# Altium project ADCS_CubeSat_1U.PrjPcb (part 2 of 2)

## Sheet 52_BUCK_5V.SchDoc
size A4; SheetNumber: 12; SheetTotal: 16
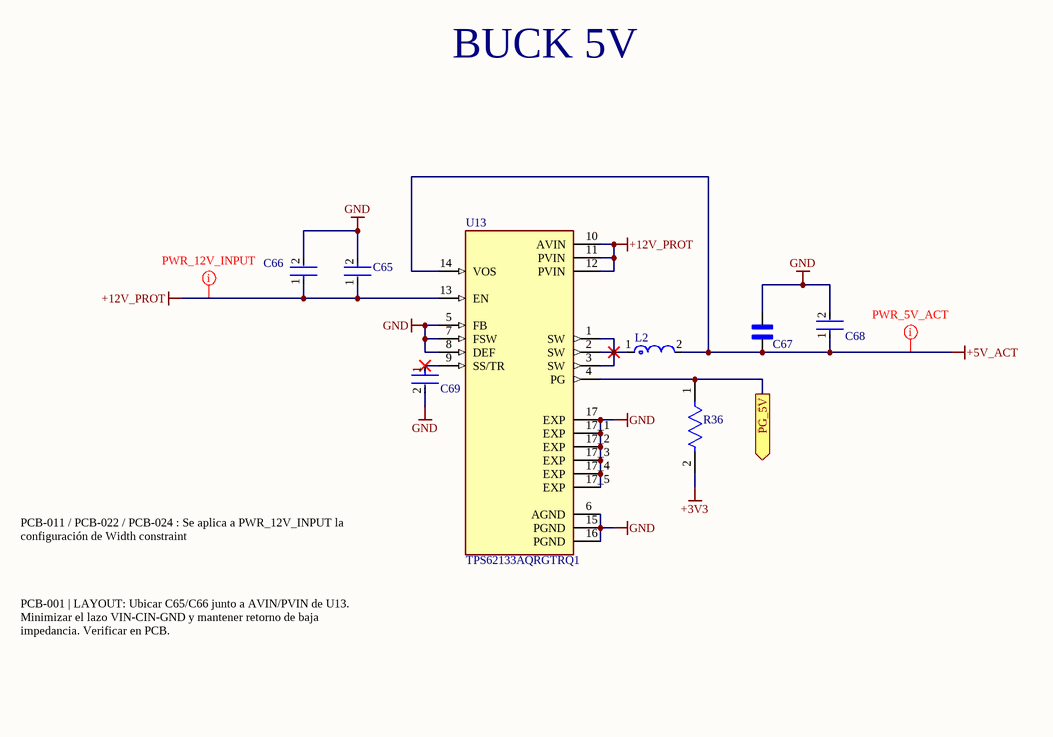
[diagram p12: 52_BUCK_5V.SchDoc]

### Parts
C65  GCM32ER71E106KA57K  [FP-GCM32E-0_3-IPC_B]  (value not drawn)
C66  C0603C104K3RACTU  [FP-C0603C-CF-IPC_B]  (value not drawn)
C67  C3225X7R1A226M230AC  [CAP_C3225X7R1A226M230AC]  (value not drawn)
C68  C0603C104K3RACTU  [FP-C0603C-CF-IPC_B]  (value not drawn)
C69  C0603C332J5GACTU  [FP-C0603C-CF-IPC_B]  (value not drawn)
L2  XFL4020-222MEC  [FP-XFL4020-MFG]  (value not drawn)
R36  RC0603FR-07100KL  [FP-RC0603-0_55-MFG]  (value not drawn)
U13  TPS62133AQRGTRQ1  [QFN50P300X300X100-17N]

### Ports
PG_5V (out)

### Nets
+3V3: R36.2
+5V_ACT: C67.2 C68.1 L2.2 U13.14(VOS)
+12V_PROT: C65.1 C66.1 U13.10(AVIN) U13.11(PVIN) U13.12(PVIN) U13.13(EN)
GND: C65.2 C66.2 C67.1 C68.2 C69.2 U13.5(FB) U13.6(AGND) U13.7(FSW) U13.8(DEF) U13.15(PGND) U13.16(PGND) U13.17(EXP) U13.17_1(EXP) U13.17_2(EXP) U13.17_3(EXP) U13.17_4(EXP) U13.17_5(EXP)
NetC69_1: C69.1 U13.9(SS/TR)
NetL2_1: L2.1 U13.1(SW) U13.2(SW) U13.3(SW)
NetR36_1: R36.1 U13.4(PG) ; port PG_5V

### Layout directives
net class PWR_12V_INPUT; rule Width Constraint [Pref Width = 78.74mil    Min Width = 59.055mil    Max Width = 118.11mil]: +12V_PROT
net class PWR_5V_ACT: +5V_ACT

### Notes on the sheet
- BUCK 5V
- PCB-011 / PCB-022 / PCB-024 : Se aplica a PWR_12V_INPUT la configuración de Width constraint
- PCB-001 | LAYOUT: Ubicar C65/C66 junto a AVIN/PVIN de U13. Minimizar el lazo VIN-CIN-GND y mantener retorno de baja impedancia. Verificar en PCB.

### Library data of the parts
C65 = CMP-2000-06320-2: Ceramic Capacitor for Automotive 10uF ±10% 25VDC X7R 1210 Embossed T/R; Voltage Rating (DC): 25V; Height: 2.5mm; Ratings: AEC-Q200; Termination: SMD/SMT; Case Code (Imperial): 1210; Packaging: Tape and Reel; Min Operating Temperature: -55°C; Radiation Hardening: No; Mount: Surface Mount; Depth: 2.5mm; Case Code (Metric): 3225; Length: 3.2mm; Tolerance: 10%; Package Quantity: 4000; Width: 0.098inch; Max Operating Temperature: 125°C; Thickness: 0.106inch; Case/Package: 1210; Capacitance: 10uF; Voltage Rating: 25V; Dielectric: X7R
C66 C68 = CMP-2006-03057-2: CAP CER 0.1UF 25V X7R 0603; Manufacturer: KEMET; Value: 0.10 μF; Material: Ceramic; Tolerance: 0.1; Temperature Coefficient: 30ppm/°C; Automotive Grade: Grade 1; Lead Free: Yes; Device Class L3: Ceramic Capacitors; Voltage Rating: 25 V; Manufacturer Part Number: C0603C104K3RACTU; Digikey Description: CAP CER 0.1UF 25V X7R 0603; Mouser Description: Multilayer Ceramic Capacitors MLCC - SMD/SMT 25volts 0.1uF X7R 10%; Package: C0603C-CF; Temperature Range Low: -55°C; Automotive: Yes; Device Class L2: Capacitors; Octopart: https://octopart.com/c0603c104k3ractu-kemet-127541; ComponentLink2Description: Datasheet; ComponentLink2URL: https://api.kemet.com/component-edge/download/datasheet/C0603C100J5GACAUTO.pdf; Temperature Range High: +125°C; RoHS: TRUE; Device Class L1: Passive Components; Category: Cap; Temperature: -55°C to +125°C; Capacitance: 0.10 μF; Height: 0.87mm; Temperature Characteristic: X7R
C67 = C3225X7R1A226M230AC: 22 ÂµF Â±20% 10V Ceramic Capacitor X7R 1210 (3225 Metric); MF: TDK; SnapEDA_Link: https://www.snapeda.com/parts/C3225X7R1A226M230AC/TDK/view-part/?ref=snap; Package: 3225-2 TDK; Value: *; MP: C3225X7R1A226M230AC; Check_prices: https://www.snapeda.com/parts/C3225X7R1A226M230AC/TDK/view-part/?ref=eda
C69 = CMP-2006-03334-2: CAP CER 3300PF 50V 5% NP0 0603; Manufacturer: KEMET; Value: 3,300 pF; Temperature Characteristic: C0G; Temperature Coefficient: 30ppm/°C; Tolerance: 0.05; Automotive Grade: Grade 1; Material: Ceramic; Category: Cap; Digikey Description: CAP CER 3300PF 50V 5% NP0 0603; Temperature Range Low: -55°C; Mouser Description: Multilayer Ceramic Capacitors MLCC - SMD/SMT 50volts 3300pF 5% C0G; Device Class L2: Capacitors; Octopart: https://octopart.com/c0603c332j5gactu-kemet-12580539; Package: C0603C-CF; Lead Free: Yes; Temperature Range High: +125°C; Automotive: Yes; ComponentLink2URL: https://api.kemet.com/component-edge/download/datasheet/C0603C100J5GACAUTO.pdf; Voltage Rating: 50 V; Device Class L3: Ceramic Capacitors; Temperature: -55°C to +125°C; ComponentLink2Description: Datasheet; Device Class L1: Passive Components; Manufacturer Part Number: C0603C332J5GACTU; Capacitance: 3,300 pF; Height: 0.87mm; RoHS: TRUE
L2 = CMP-2000-05090-4: INDUCTOR, 2.2UH, 8A, 20%, 38MHZ, REEL; Test Frequency: 100kHz; Shielding: Shielded; Saturation Current: 3.1A; DC Resistance (DCR): 23.5mR; Core Material: Composite; Height: 2.1mm; Width: 4.3mm; Mount: Surface Mount; RMS Current (Irms): 8A; Case/Package: SMD/SMT; Length: 4.3mm; REACH SVHC: No SVHC; Max DC Current: 8A; Min Operating Temperature: -40°C; Series: XFL4020; Self Resonant Frequency: 38MHz; Inductance Tolerance: 20%; Lead Free: Contains Lead; Tolerance: 20%; RoHS Compliant: Yes; Termination: SMD/SMT; Packaging: Tape and Reel; Max Operating Temperature: 125°C; Inductance: 2.2uH
R36 = CMP-2100-03662-2: RES SMD 100K OHM 1% 1/10W 0603; Voltage Rating (DC): 50V; Resistance: 100kR; Max Power Dissipation: 100mW; Temperature Coefficient: 100ppm/°C; Working Voltage: 75V; Length: 1.6mm; Lead Free: Lead Free; Number of Terminations: 2; Packaging: Tape and Reel; Voltage Rating: 50V; Termination: SMD/SMT; Width: 0.8mm; Resistor Type: Thick Film; Resistance Tolerance: 1%; Features: Moisture Resistant; Height: 0.45mm; Construction: Rectangular; Case/Package: 0603; Military Standard: Not; Case Code (Imperial): 0603; Series: RC; Technology: THICK FILM; Depth: 0.8mm; RoHS Compliant: Yes; REACH SVHC: No SVHC; Min Operating Temperature: -55°C; Case Code (Metric): 1608; Max Operating Temperature: 155°C; Power Rating: 100mW; Number of Pins: 2; Tolerance: 1%
U13 = TPS62133AQRGTRQ1: 3V - 17V 3A AUTOMOTIVE Step-Down Converter In 3X3 QFN Package; MF: Texas Instruments; SnapEDA_Link: https://www.snapeda.com/parts/TPS62133AQRGTRQ1/Texas+Instruments/view-part/?ref=snap; Package: VQFN-16 Texas Instruments; Value: *; MP: TPS62133AQRGTRQ1; Check_prices: https://www.snapeda.com/parts/TPS62133AQRGTRQ1/Texas+Instruments/view-part/?ref=eda

## Sheet 53_BUCK_3V3.SchDoc
size A4; SheetNumber: 13; SheetTotal: 16
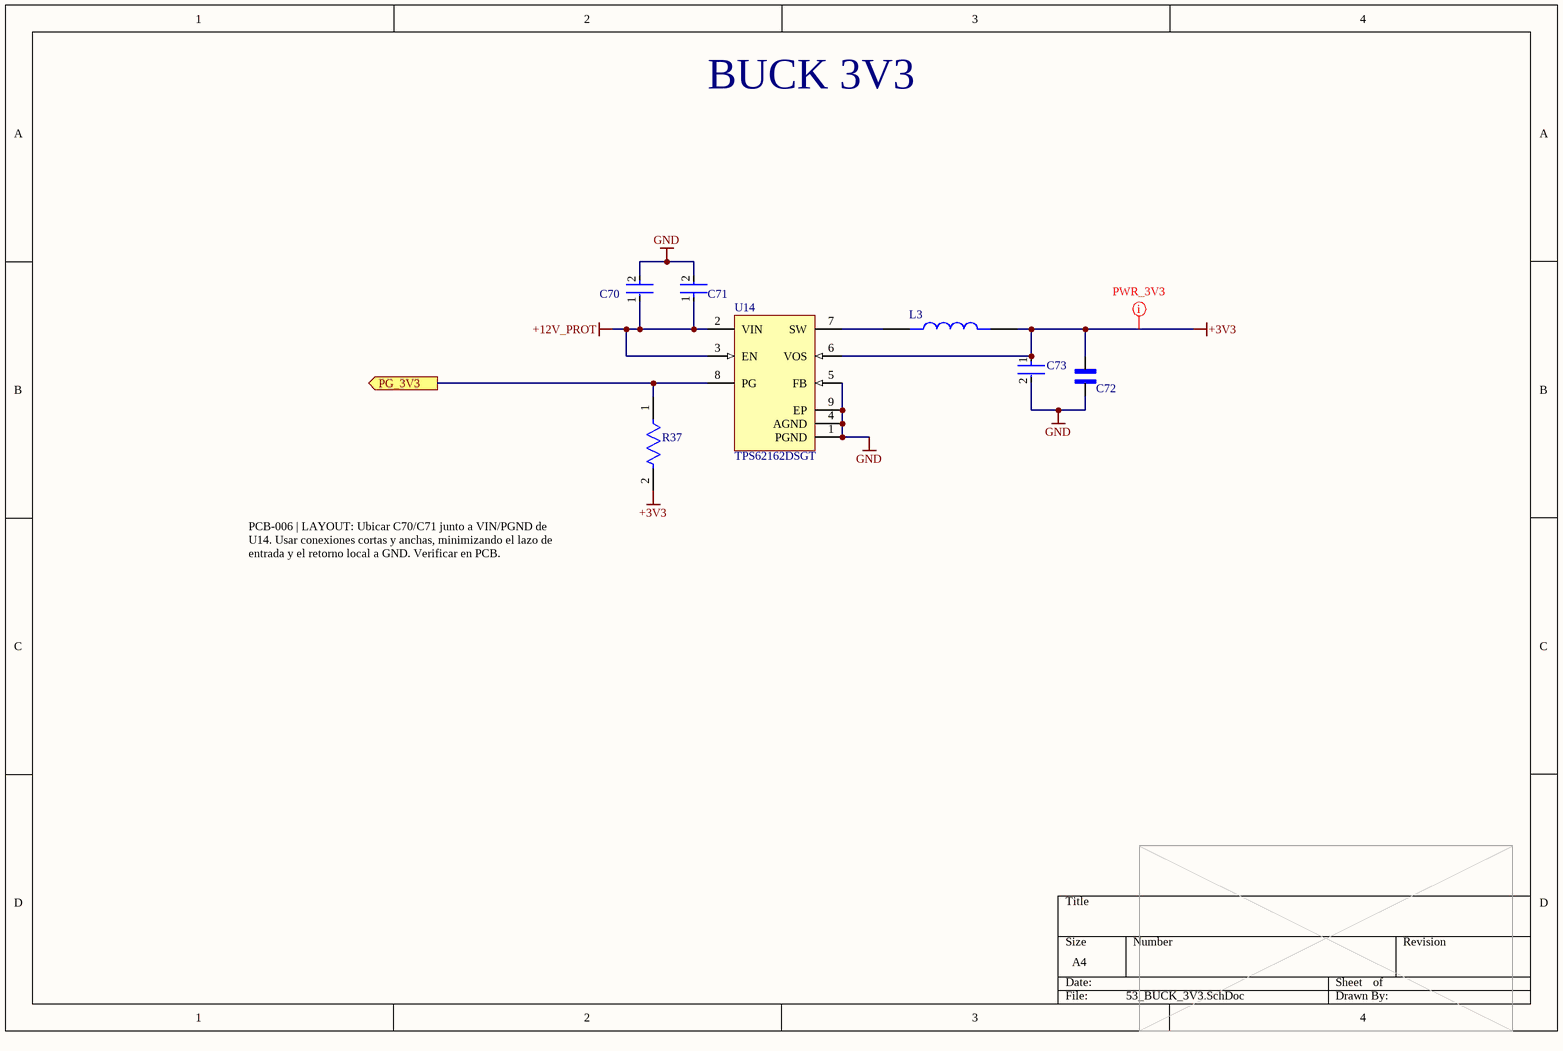
[diagram p13: 53_BUCK_3V3.SchDoc]

### Parts
C70  GCM32ER71E106KA57K  [FP-GCM32E-0_3-IPC_B]  (value not drawn)
C71  C0603C104K3RACTU  [FP-C0603C-CF-IPC_B]  (value not drawn)
C72  C1210C226K8RACAUTO  [CAPC3225X280N]  (value not drawn)
C73  C0603C104K3RACTU  [FP-C0603C-CF-IPC_B]  (value not drawn)
L3  VLS3012HBX-2R2M-N  [IND_VLS3012HBX-2R2M-N]  (value not drawn)
R37  RC0603FR-07100KL  [FP-RC0603-0_55-MFG]  (value not drawn)
U14  TPS62162DSGT  [DSG0008A_V]

### Ports
PG_3V3 (out)

### Nets
+3V3: C72.2 C73.1 L3.2 R37.2 U14.6(VOS)
+12V_PROT: C70.1 C71.1 U14.2(VIN) U14.3(EN)
GND: C70.2 C71.2 C72.1 C73.2 U14.1(PGND) U14.4(AGND) U14.5(FB) U14.9(EP)
NetL3_1: L3.1 U14.7(SW)
NetR37_1: R37.1 U14.8(PG) ; port PG_3V3

### Layout directives
net class PWR_3V3: +3V3

### Notes on the sheet
- BUCK 3V3
- PCB-006 | LAYOUT: Ubicar C70/C71 junto a VIN/PGND de U14. Usar conexiones cortas y anchas, minimizando el lazo de entrada y el retorno local a GND. Verificar en PCB.

### Library data of the parts
C70 = CMP-2000-06320-2: as C65 on sheet 52_BUCK_5V; Height: 2.5mm; Ratings: AEC-Q200; Termination: SMD/SMT; Case Code (Imperial): 1210; Packaging: Tape and Reel; Min Operating Temperature: -55°C; Radiation Hardening: No; Mount: Surface Mount; Depth: 2.5mm; Case Code (Metric): 3225; Length: 3.2mm; Tolerance: 10%; Package Quantity: 4000; Width: 0.098inch; Max Operating Temperature: 125°C; Thickness: 0.106inch; Case/Package: 1210; Capacitance: 10uF; Voltage Rating: 25V; Dielectric: X7R
C71 C73 = CMP-2006-03057-2: as C66 on sheet 52_BUCK_5V; Lead Free: Yes; Device Class L3: Ceramic Capacitors; Voltage Rating: 25 V; Manufacturer Part Number: C0603C104K3RACTU; Digikey Description: CAP CER 0.1UF 25V X7R 0603; Mouser Description: Multilayer Ceramic Capacitors MLCC - SMD/SMT 25volts 0.1uF X7R 10%; Package: C0603C-CF; Temperature Range Low: -55°C; Automotive: Yes; Device Class L2: Capacitors; Octopart: https://octopart.com/c0603c104k3ractu-kemet-127541; ComponentLink2Description: Datasheet; ComponentLink2URL: https://api.kemet.com/component-edge/download/datasheet/C0603C100J5GACAUTO.pdf; Temperature Range High: +125°C; RoHS: TRUE; Device Class L1: Passive Components; Category: Cap; Temperature: -55°C to +125°C; Capacitance: 0.10 μF; Height: 0.87mm; Temperature Characteristic: X7R
C72 = C1210C226K8RACAUTO: 22 ÂµF Â±10% 10V Ceramic Capacitor X7R 1210 (3225 Metric); MF: KEMET; SnapEDA_Link: https://www.snapeda.com/parts/C1210C226K8RACAUTO/Kemet/view-part/?ref=snap; Package: 1210-2 KEMET; Value: *; MP: C1210C226K8RACAUTO; Check_prices: https://www.snapeda.com/parts/C1210C226K8RACAUTO/Kemet/view-part/?ref=eda
L3 = VLS3012HBX-2R2M-N: INDUCTORS FOR POWER CIRCUITS, WO; MF: TDK Corporation; Package: None; Purchase-URL: https://pricing.snapeda.com/search/part/VLS3012HBX-2R2M-N/?ref=eda; Value: *; Availability: In Stock; SnapEDA_Link: https://www.snapeda.com/parts/VLS3012HBX-2R2M-N/TDK/view-part/?ref=snap; MP: VLS3012HBX-2R2M-N; Price: None; Check_prices: https://www.snapeda.com/parts/VLS3012HBX-2R2M-N/TDK/view-part/?ref=eda
R37 = CMP-2100-03662-2: as R36 on sheet 52_BUCK_5V; Length: 1.6mm; Lead Free: Lead Free; Number of Terminations: 2; Packaging: Tape and Reel; Voltage Rating: 50V; Termination: SMD/SMT; Width: 0.8mm; Resistor Type: Thick Film; Resistance Tolerance: 1%; Features: Moisture Resistant; Height: 0.45mm; Construction: Rectangular; Case/Package: 0603; Military Standard: Not; Case Code (Imperial): 0603; Series: RC; Technology: THICK FILM; Depth: 0.8mm; RoHS Compliant: Yes; REACH SVHC: No SVHC; Min Operating Temperature: -55°C; Case Code (Metric): 1608; Max Operating Temperature: 155°C; Power Rating: 100mW; Number of Pins: 2; Tolerance: 1%
U14 = CMP-0323-00319-3: Buck Step Down Regulator with 3 to 17 V Input and 3.3 V Output, -40 to 85 degC, 8-Pin WSON (DSG), Green (RoHS & no Sb/Br); Manufacturer: Texas Instruments; Synchronous Rectification: TRUE; Iq(Typ)(mA): 0.017; Switch Current Limit(Typ)(A): 1.8; Regulated Outputs(#): 1; Duty Cycle(Max)(%): 100; SubFamily: Step-Down Regulator; Preset Vout(V): 3.3; Rating: Catalog; Vin(Max)(V): 17; Vin(Min)(V): 3; ComponentLink2Description: Package Specification; PackageVersion: revB, Oct-2010; DatasheetVersion: SLVSAM2A; ComponentLink1Description: Datasheet; PackageDescription: 8-Pin Plastic Small Outline No-Lead, 2 x 2 x 0.8 mm Body, 0.5 mm Pitch, Exposed Pad; ComponentLink2URL: http://www.ti.com/litv/pdf/mpds308a; Code_JEDEC: MO-229; PartNumber: TPS62162DSGT; ComponentLink3URL: Samples URL:http://www.ti.com/product/tps54611#samples; Mounting Technology: Surface Mount; Eco-Plan: Green (RoHS & no Sb/Br); Vout(Min)(V): 3.3; PackageReference: DSG0008A; Topology: Buck; ComponentLink1URL: http://www.ti.com/general/docs/lit/getliterature.tsp?genericPartNumber=TPS62162&fileType=pdf; Vout(Max)(V): 3.3; Iout(Max)(A): 1; ComponentLink3Description: URL Link1

## Sheet 54_ANALOG_POWER.SchDoc
size A4; SheetNumber: 15; SheetTotal: 16
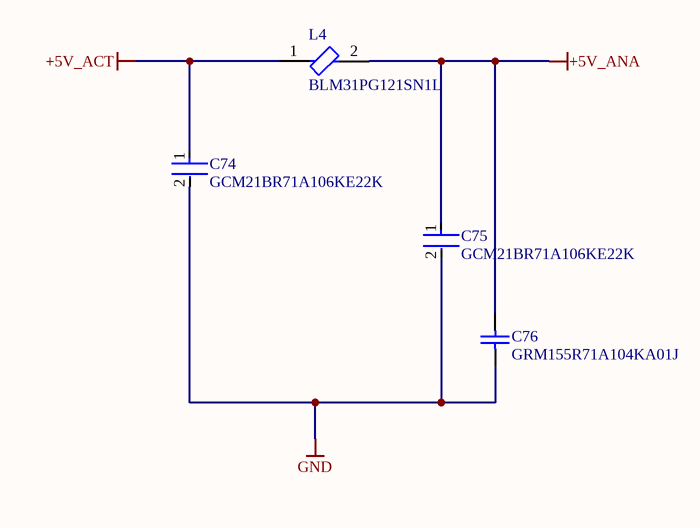
[diagram p14: 54_ANALOG_POWER.SchDoc]

### Parts
C74  GCM21BR71A106KE22K  [FP-GCM21B-0_15-MFG]
C75  GCM21BR71A106KE22K  [FP-GCM21B-0_15-MFG]
C76  GRM155R71A104KA01J  [CAPC1005X55X25ML05T10]
L4  BLM31PG121SN1L  [FP-BLM31-0_2-t1_1-MFG]

### Nets
+5V_ACT: C74.1 L4.1
+5V_ANA: C75.1 C76.2 L4.2
GND: C74.2 C75.2 C76.1

### Library data of the parts
C74 C75 = CMP-06035-062139-1: Ceramic Capacitor for Automotive 10uF ±10% 10VDC X7R 0805 Embossed T/R; Voltage Rating: 10V; Mount: Surface Mount; Max Operating Temperature: 125°C; Tolerance: 10%; Voltage Rating (DC): 10V; Dielectric: X7R; RoHS Compliant: Yes; Package Quantity: 10000; Min Operating Temperature: -55°C; Case/Package: 0805; Case Code (Imperial): 0805; Thickness: 0.055inch; Weight: 0.000335oz; Length: 0.079inch; Ratings: AEC-Q200; Case Code (Metric): 2012; Termination: SMD/SMT; Width: 1.25mm; Height: 1.25mm; Packaging: Tape and Reel; Capacitance: 10uF
C76 = CMP-2008-04031-1: Manufacturer: Murata; Part Number: GRM155R71A104KA01J
L4 = CMP-0686-00732-3: Chip Ferrite Bead Array, 1206, 120Ω @ 100MHz, 0.02Ω, 25%, 3.5A; Number of Lines: 1; DC Current: 3A; Impedance: 120R; Material: Steel; DC Resistance (DCR): 20mR; Shielding: Unshielded; Number of Pins: 2; Case Code (Metric): 3216; Contact Plating: Tin; Radiation Hardening: No; Termination: SMD/SMT; Lead Free: Lead Free; Core Material: Ferrite; Case Code (Imperial): 1206; Test Frequency: 100MHz; Depth: 1.6mm; Max Operating Temperature: 125°C; Package Quantity: 3000; Packaging: Tape and Reel; Min Operating Temperature: -55°C; Length: 3.2mm; Current Rating: 3.5A; RoHS Compliant: Yes; Tolerance: 25%; Width: 1.6mm; Max Current Rating: 3.5A; Frequency: 100MHz; Military Standard: Not; Case/Package: 1206; Max DC Current: 3A; Height: 1.1mm

## Sheet Adquicision_Analogica.SchDoc
size A4; SheetNumber: 16; SheetTotal: 16
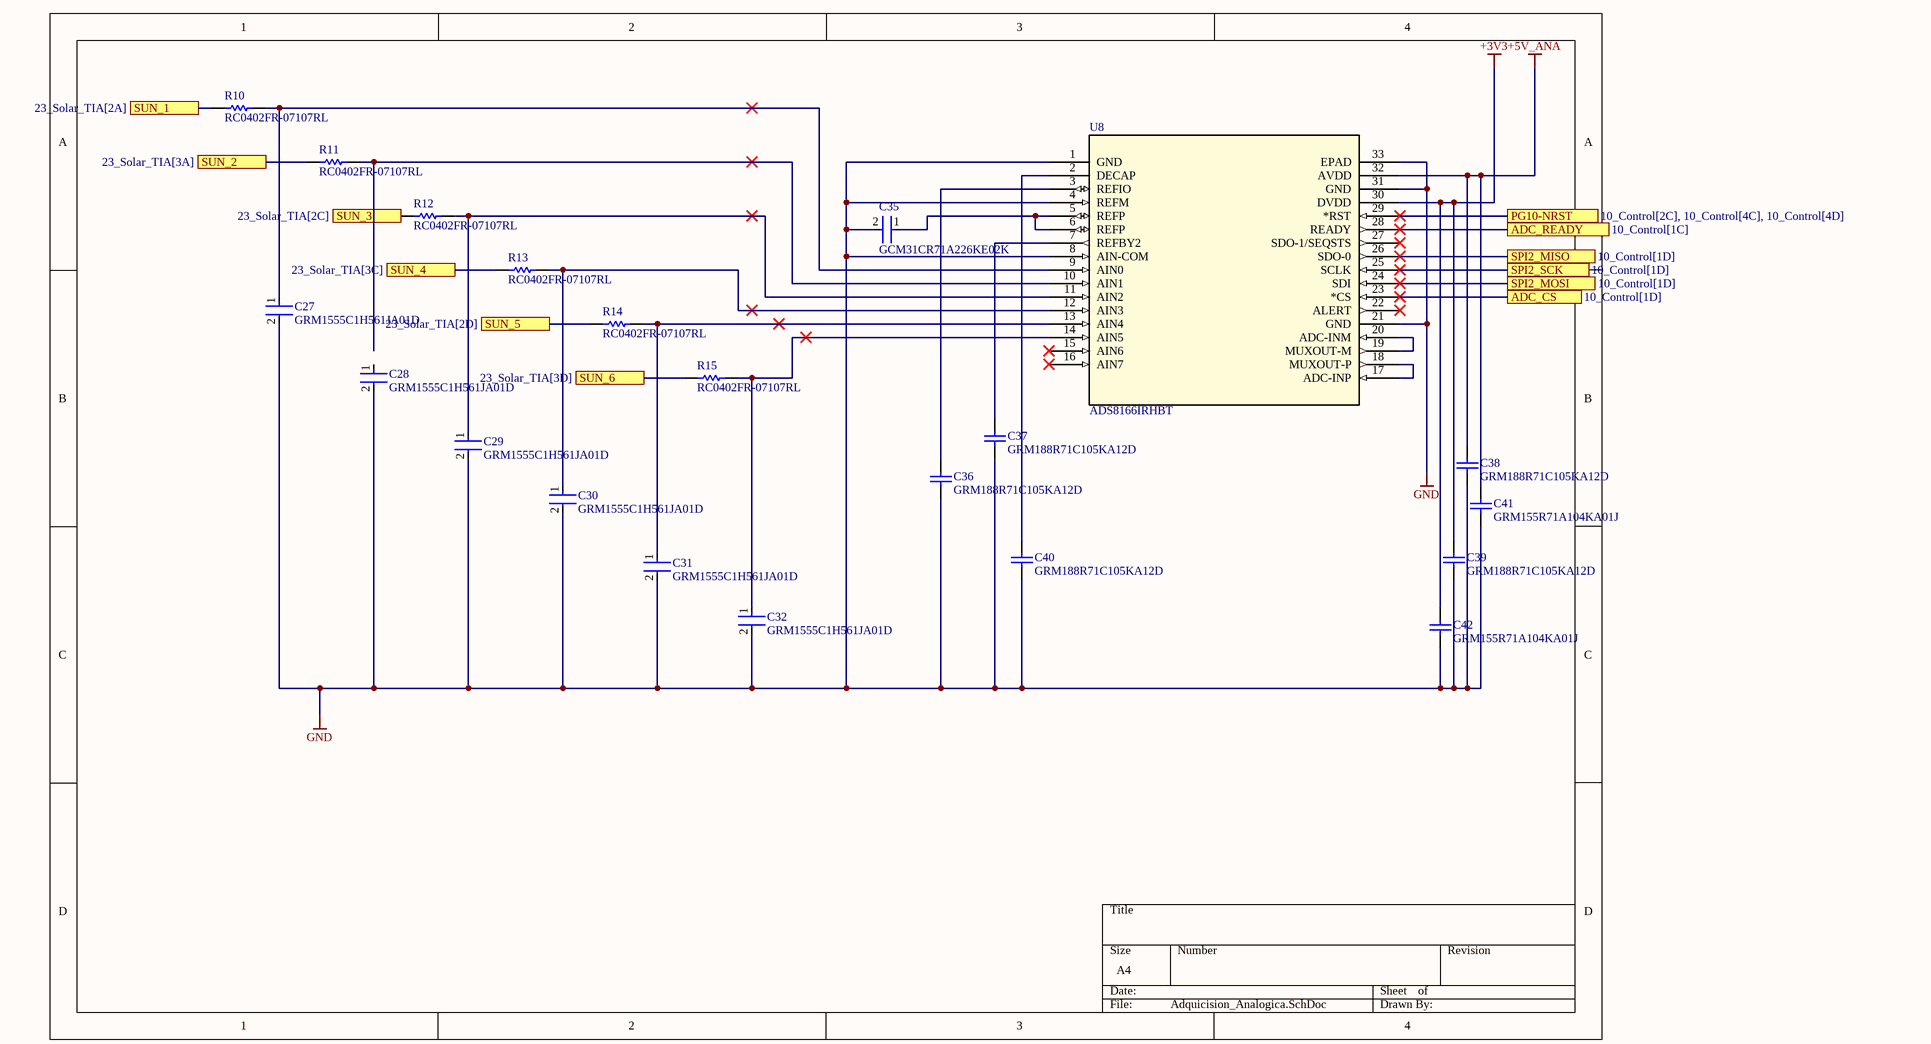
[diagram p15: Adquicision_Analogica.SchDoc]

### Parts
C27  GRM1555C1H561JA01D  [FP-GRM155-0_05-IPC_C]
C28  GRM1555C1H561JA01D  [FP-GRM155-0_05-IPC_C]
C29  GRM1555C1H561JA01D  [FP-GRM155-0_05-IPC_C]
C30  GRM1555C1H561JA01D  [FP-GRM155-0_05-IPC_C]
C31  GRM1555C1H561JA01D  [FP-GRM155-0_05-IPC_C]
C32  GRM1555C1H561JA01D  [FP-GRM155-0_05-IPC_C]
C35  GCM31CR71A226KE02K  [FP-GCM31C-0_2-e0_3_0_8-IPC_A]
C36  GRM188R71C105KA12D  [CAPC1608X90X35ML10T15]
C37  GRM188R71C105KA12D  [CAPC1608X90X35ML10T15]
C38  GRM188R71C105KA12D  [CAPC1608X90X35ML10T15]
C39  GRM188R71C105KA12D  [CAPC1608X90X35ML10T15]
C40  GRM188R71C105KA12D  [CAPC1608X90X35ML10T15]
C41  GRM155R71A104KA01J  [CAPC1005X55X25ML05T10]
C42  GRM155R71A104KA01J  [CAPC1005X55X25ML05T10]
R10  RC0402FR-07107RL  [RESC1005X40X25ML05T10]
R11  RC0402FR-07107RL  [RESC1005X40X25ML05T10]
R12  RC0402FR-07107RL  [RESC1005X40X25ML05T10]
R13  RC0402FR-07107RL  [RESC1005X40X25ML05T10]
R14  RC0402FR-07107RL  [RESC1005X40X25ML05T10]
R15  RC0402FR-07107RL  [RESC1005X40X25ML05T10]
U8  ADS8166IRHBT  [RHB32_TEX]

### Ports
ADC_CS (see 10_Control[1D]), ADC_READY (see 10_Control[1C]), PG10-NRST (see 10_Control[2C], 10_Control[4C], 10_Control[4D]), SPI2_MISO (see 10_Control[1D]), SPI2_MOSI (see 10_Control[1D]), SPI2_SCK (see 10_Control[1D]), SUN_1 (see 23_Solar_TIA[2A]), SUN_2 (see 23_Solar_TIA[3A]), SUN_3 (see 23_Solar_TIA[2C]), SUN_4 (see 23_Solar_TIA[3C]), SUN_5 (see 23_Solar_TIA[2D]), SUN_6 (see 23_Solar_TIA[3D])

### Nets
+3V3: C39.2 C42.1 U8.30(DVDD)
+5V_ANA: C38.2 C41.2 U8.32(AVDD)
GND: C27.2 C28.2 C29.2 C30.2 C31.2 C32.2 C35.2 C36.1 C37.1 C38.1 C39.1 C40.1 C41.1 C42.2 U8.1(GND) U8.4(REFM) U8.8(AIN-COM) U8.21(GND) U8.31(GND) U8.33(EPAD)
NetC11_1: U8.29(*RST) ; port PG10-NRST
NetC18_2: R10.1 ; port SUN_1
NetC19_2: R11.1 ; port SUN_2
NetC20_2: R12.1 ; port SUN_3
NetC21_2: R13.1 ; port SUN_4
NetC22_2: R14.1 ; port SUN_5
NetC23_2: R15.1 ; port SUN_6
NetC27_1: C27.1 R10.2 U8.9(AIN0)
NetC29_1: C29.1 R12.2 U8.11(AIN2)
NetC30_1: C30.1 R13.2 U8.12(AIN3)
NetC31_1: C31.1 R14.2 U8.13(AIN4)
NetC32_1: C32.1 R15.2 U8.14(AIN5)
NetC35_1: C35.1 U8.5(REFP) U8.6(REFP)
NetC36_2: C36.2 U8.3(REFIO)
NetC37_2: C37.2 U8.7(REFBY2)
NetC40_2: C40.2 U8.2(DECAP)
NetR11_2: R11.2 U8.10(AIN1)
NetU1_33: U8.23(*CS) ; port ADC_CS
NetU1_35: U8.25(SCLK) ; port SPI2_SCK
NetU1_36: U8.26(SDO-0) ; port SPI2_MISO
NetU1_37: U8.24(SDI) ; port SPI2_MOSI
NetU1_51: U8.28(READY) ; port ADC_READY
NetU8_17: U8.17(ADC-INP) U8.18(MUXOUT-P)
NetU8_19: U8.19(MUXOUT-M) U8.20(ADC-INM)

Not connected (* = marked no-connect by the designer): C28 1; U8 15(AIN6)* 16(AIN7)* 22(ALERT)* 27(SDO-1/SEQSTS)*

### Library data of the parts
C27-C32 = CMP-2008-04388-2: Chip Multilayer Ceramic Capacitors for General Purpose, 0402, 560pF, C0G, 30ppm/°C, 5%, 50V; Temperature Coefficient: 30ppm/°C; Dielectric: C0G; Termination: SMD/SMT; Width: 0.02inch; Thickness: 0.022inch; Capacitance: 560pF; Min Operating Temperature: -55°C; Case/Package: 0402; Mount: Surface Mount; Voltage Rating: 50V; Depth: 0.5mm; Voltage: 50V; Material: Ceramic; Voltage Rating (DC): 50V; Radiation Hardening: No; REACH SVHC: No SVHC; Case Code (Metric): 1005; Case Code (Imperial): 0402; Max Operating Temperature: 125°C; Length: 1mm; Package Quantity: 1; Tolerance: 5%; Lead Free: Lead Free; Packaging: Tape and Reel; Height: 0.5mm
C35 = CMP-06035-059468-1: Ceramic Capacitor for Automotive 22uF ±10% 10VDC X7R 1206 Embossed T/R
C36-C40 = CMP-2006-02845-1: Manufacturer: Murata; Part Number: GRM188R71C105KA12D
C41 C42 = CMP-2008-04031-1: Manufacturer: Murata; Part Number: GRM155R71A104KA01J
R10-R15 = CMP-2002-07349-1: Manufacturer: Yageo / Phycomp; Part Number: RC0402FR-07107RL
U8 = ADS8166IRHBT: 16-bit, 250-kSPS, 8-ch SAR ADC with VREF, VREF buffer and direct sensor interface 32-VQFN -40 to 125; Manufacturer_Name: Texas Instruments; Copyright: Copyright (C) 2025 Ultra Librarian. All rights reserved.; Manufacturer_Part_Number: ADS8166IRHBT; RefDes: RefDes; Type: Type

## Nets that join several sheets
+3V3: 10_Control (17 pins), 21_IMU (5 pins), 22_Magnetometro (C15.2 C16.2 U5.2 U5.13), 32_Magnetor (R26.2 R27.2), 40_CANFD (C58.2 U11.5), 51_INPUT_PROTECTION (R35.2), 52_BUCK_5V (R36.2), 53_BUCK_3V3 (5 pins), Adquicision_Analogica (C39.2 C42.1 U8.30)
+5V_ACT: 31_Ruedas (6 pins), 32_Magnetor (8 pins), 52_BUCK_5V (C67.2 C68.1 L2.2 U13.14), 54_ANALOG_POWER (C74.1 L4.1)
+5V_ANA: 23_Solar_TIA (5 pins), 54_ANALOG_POWER (C75.1 C76.2 L4.2), Adquicision_Analogica (C38.2 C41.2 U8.32)
+12V_PROT: 51_INPUT_PROTECTION (C63.1 C64.1 U12.23 U12.24), 52_BUCK_5V (6 pins), 53_BUCK_3V3 (C70.1 C71.1 U14.2 U14.3)
GND: 10_Control (19 pins), 21_IMU (5 pins), 22_Magnetometro (5 pins), 23_Solar_TIA (19 pins), 31_Ruedas (18 pins), 32_Magnetor (18 pins), 40_CANFD (7 pins), 51_INPUT_PROTECTION (12 pins), 52_BUCK_5V (17 pins), 53_BUCK_3V3 (8 pins), 54_ANALOG_POWER (C74.2 C75.2 C76.1), Adquicision_Analogica (20 pins)
NetC11_1: 10_Control (C11.1 D1.2 J1.04 U1.7), Adquicision_Analogica (U8.29)
NetC18_2: 23_Solar_TIA (C18.2 R4.2 U6.1), Adquicision_Analogica (R10.1)
NetC19_2: 23_Solar_TIA (C19.2 R5.2 U6.7), Adquicision_Analogica (R11.1)
NetC20_2: 23_Solar_TIA (C20.2 R6.2 U6.8), Adquicision_Analogica (R12.1)
NetC21_2: 23_Solar_TIA (C21.2 R7.2 U6.14), Adquicision_Analogica (R13.1)
NetC22_2: 23_Solar_TIA (C22.2 R8.2 U7.1), Adquicision_Analogica (R14.1)
NetC23_2: 23_Solar_TIA (C23.2 R9.2 U7.7), Adquicision_Analogica (R15.1)
NetJ2_2: 10_Control (U1.24), 31_Ruedas (J2.2 R21.1)
NetJ2_3: 10_Control (U1.53), 31_Ruedas (J2.3 J3.3 J4.3)
NetJ2_4: 10_Control (U1.54), 31_Ruedas (J2.4 J3.4 J4.4)
NetJ2_5: 10_Control (U1.52), 31_Ruedas (J2.5 J3.5 J4.5)
NetJ2_6: 10_Control (U1.56), 31_Ruedas (J2.6)
NetJ3_2: 10_Control (U1.25), 31_Ruedas (J3.2 R22.1)
NetJ3_6: 10_Control (U1.57), 31_Ruedas (J3.6)
NetJ4_2: 10_Control (U1.26), 31_Ruedas (J4.2 R23.1)
NetJ4_6: 10_Control (U1.58), 31_Ruedas (J4.6)
NetR18_1: 10_Control (U1.38), 31_Ruedas (R18.1 SW1.3)
NetR19_1: 10_Control (U1.39), 31_Ruedas (R19.1 SW2.3)
NetR20_1: 10_Control (U1.40), 31_Ruedas (R20.1 SW3.3)
NetR35_1: 10_Control (U1.60), 51_INPUT_PROTECTION (R35.1 U12.22)
NetU1_8: 10_Control (U1.8), 21_IMU (U4.12)
NetU1_9: 10_Control (U1.9), 22_Magnetometro (U5.4)
NetU1_10: 10_Control (U1.10), 22_Magnetometro (U5.15)
NetU1_12: 10_Control (U1.12), 32_Magnetor (U9.16)
NetU1_13: 10_Control (U1.13), 32_Magnetor (U9.15)
NetU1_14: 10_Control (U1.14), 32_Magnetor (U9.9)
NetU1_17: 10_Control (U1.17), 32_Magnetor (U9.10)
NetU1_19: 10_Control (U1.19), 21_IMU (U4.13), 22_Magnetometro (U5.1)
NetU1_20: 10_Control (U1.20), 21_IMU (U4.1), 22_Magnetometro (U5.5)
NetU1_21: 10_Control (U1.21), 21_IMU (U4.14), 22_Magnetometro (U5.16)
NetU1_22: 10_Control (U1.22), 21_IMU (U4.4)
NetU1_23: 10_Control (U1.23), 21_IMU (U4.9)
NetU1_33: 10_Control (U1.33), Adquicision_Analogica (U8.23)
NetU1_35: 10_Control (U1.35), Adquicision_Analogica (U8.25)
NetU1_36: 10_Control (U1.36), Adquicision_Analogica (U8.26)
NetU1_37: 10_Control (U1.37), Adquicision_Analogica (U8.24)
NetU1_42: 10_Control (U1.42), 32_Magnetor (U10.16)
NetU1_43: 10_Control (U1.43), 32_Magnetor (U10.15)
NetU1_45: 10_Control (U1.45), 40_CANFD (U11.4)
NetU1_46: 10_Control (U1.46), 40_CANFD (U11.1)
NetU1_51: 10_Control (U1.51), Adquicision_Analogica (U8.28)